# Altium schematic sheet 300_DC-DC.SchDoc: DC-DC Convertion stage
size A4; Date: XXXXXX; Author: Y.Gonzalez; Revision: R1V0; SheetNumber: 4; SheetTotal: 5
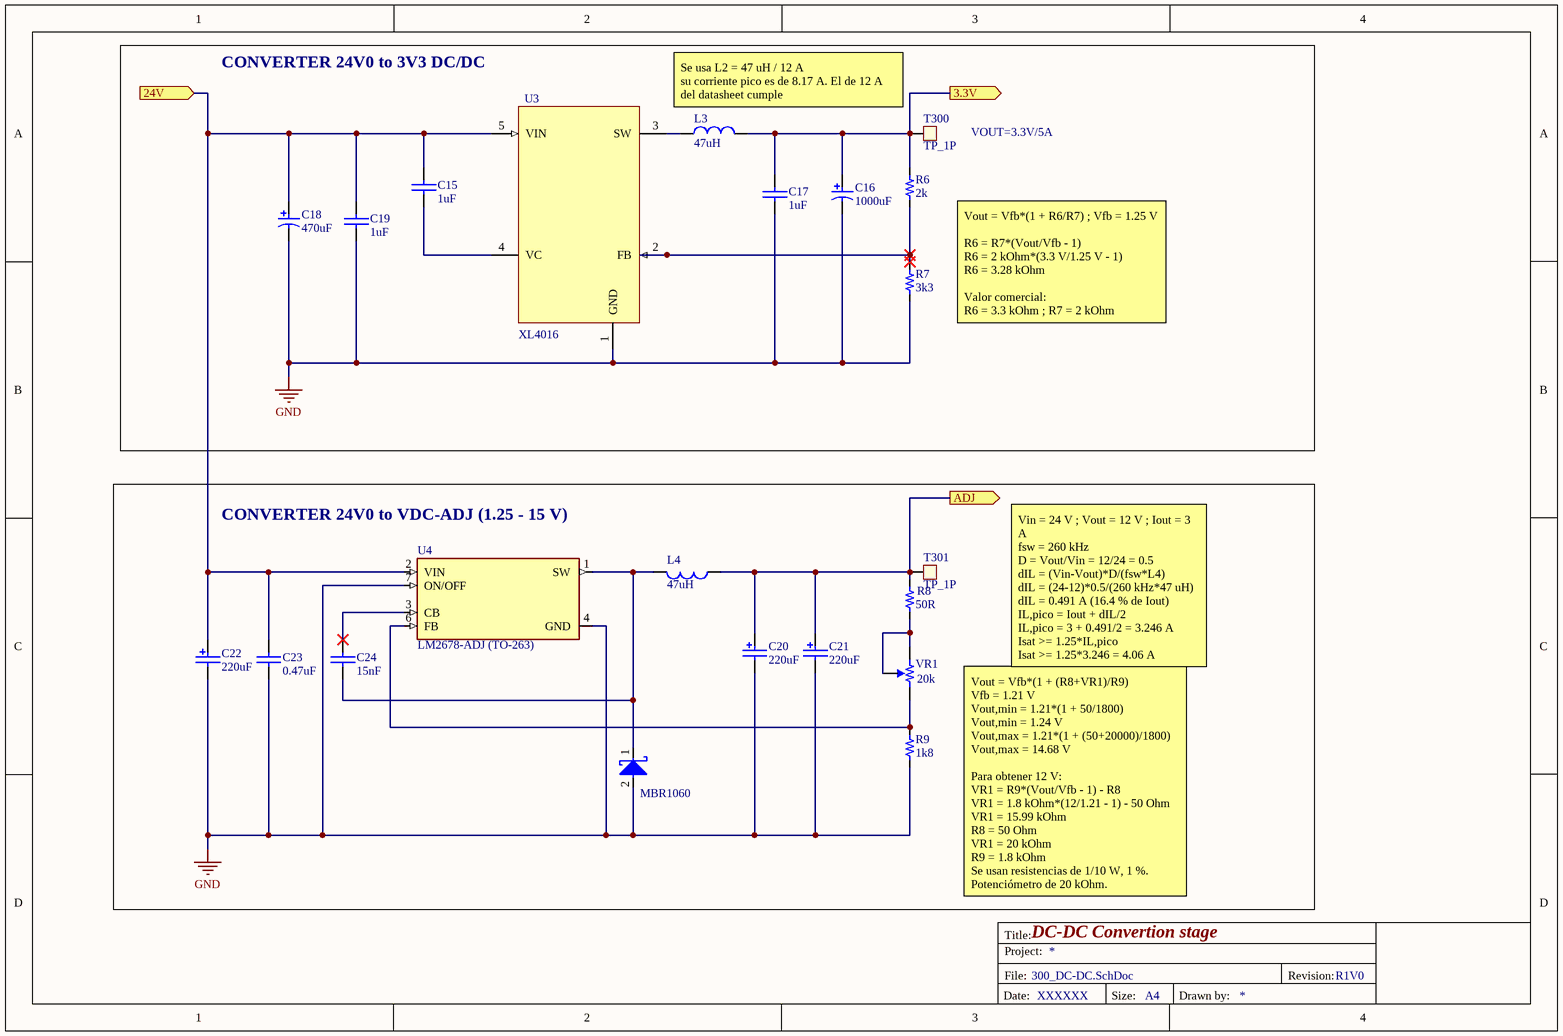
[diagram p0: 300_DC-DC.SchDoc]

## Parts
C15  value 1uF  [1206]  (hidden comment: 1uF 100V)
C16  value 1000uF  [RADIAL-CAN_LSx5mm_Diax10mm_Hx14mm]  (hidden comment: 1000uF 25V)
C17  value 1uF  [0805]  (hidden comment: 1uF 25V)
C18  value 470uF  [RADIAL-CAN-SMD_DIAX8MM_HX10MM]  (hidden comment: 470uF 10V)
C19  value 1uF  [1206]  (hidden comment: 1uF 100V)
C20  value 220uF  [RADIAL-CAN-SMD_Diax8mm_Hx10.2mm]  (hidden comment: 220uF 35V)
C21  value 220uF  [RADIAL-CAN-SMD_Diax8mm_Hx10.2mm]  (hidden comment: 220uF 35V)
C22  value 220uF  [RADIAL-CAN-SMD_Diax8mm_Hx10.2mm]  (hidden comment: 220uF 50V)
C23  value 0.47uF  [0603]  (hidden comment: 0.47uF_50v)
C24  value 15nF  [0603_1.4mm]  (hidden comment: 15nF 50V)
D2  MBR1060  [D_Schottky_60V_10A_TO]
L3  value 47uH  [L_47uH_12A]  (hidden comment: FIXED IND 47UH 12A 12.2 MOHM SMD)
L4  value 47uH  [L_47uH_12A]  (hidden comment: FIXED IND 47UH 12A 12.2 MOHM SMD)
R6  value 2k  [0201]  (hidden comment: 2k 1/20W)
R7  value 3k3  [0402]  (hidden comment: 3k3 1/16W)
R8  value 50R  [0603]  (hidden comment: 50R 1/18W)
R9  value 1k8  [0603]  (hidden comment: 1k8 1/10W)
T300  TP_1P  [TP_TH_30mil]  (no BOM)
T301  TP_1P  [TP_TH_30mil]  (no BOM)
U3  XL4016  [TO-263-5]
U4  LM2678-ADJ (TO-263)  [DCDC_ADJ_5A_TO263-7]
VR1  value 20k  [Pot_3x1_2.54mm_TH_TM]  (hidden comment: 20k 1/2W)

## Blocks framed on the sheet
CONVERTER 24V0 to 3V3 DC/DC: C15-C19 L3 R6 R7 T300 U3
CONVERTER 24V0 to VDC-ADJ (1.25 - 15 V): C20-C24 D2 L4 R8 R9 T301 U4 VR1

## Ports
3.3V (out), 24V (in), ADJ (out)

## Nets
GND: C16.2 C17.2 C18.2 C19.2 C20.2 C21.2 C22.2 C23.2 D2.2 R7.1 R9.1 U3.1(GND) U4.4(GND) U4.7(ON/OFF)
3.3V: C16.1 C17.1 L3.2 R6.2 T300.1 ; port 3.3V
24V: C15.1 C18.1 C19.1 C22.1 C23.1 U3.5(VIN) U4.2(VIN) ; port 24V
ADJ: C20.1 C21.1 L4.1 R8.2 T301.1 ; port ADJ
NetC15_2: C15.2 U3.4(VC)
NetC24_1: C24.1 U4.3(CB)
NetC24_2: C24.2 D2.1 L4.2 U4.1(SW)
NetL3_1: L3.1 U3.3(SW)
NetR6_1: R6.1 R7.2 U3.2(FB)
NetR8_1: R8.1 VR1.2 VR1.3
NetR9_2: R9.2 U4.6(FB) VR1.1

## Notes on the sheet
- Se usa L2 = 47 uH / 12 A
  su corriente pico es de 8.17 A. El de 12 A del datasheet cumple
- VOUT=3.3V/5A
- Vout = Vfb*(1 + R6/R7) ; Vfb = 1.25 V
  R6 = R7*(Vout/Vfb - 1)
  R6 = 2 kOhm*(3.3 V/1.25 V - 1)
  R6 = 3.28 kOhm
  Valor comercial:
  R6 = 3.3 kOhm ; R7 = 2 kOhm
  Vout = 1.25*(1 + 3.3k/2k)
  Vout = 3.31 V (0.38 %)
  Con tolerancia 1 %:
  Vout = 3.28 V a 3.34 V
  Se usan resistencias de 1/10 W, 1 %.
- Vin = 24 V ; Vout = 12 V ; Iout = 3 A
  fsw = 260 kHz
  D = Vout/Vin = 12/24 = 0.5
  dIL = (Vin-Vout)*D/(fsw*L4)
  dIL = (24-12)*0.5/(260 kHz*47 uH)
  dIL = 0.491 A (16.4 % de Iout)
  IL,pico = Iout + dIL/2
  IL,pico = 3 + 0.491/2 = 3.246 A
  Isat >= 1.25*IL,pico
  Isat >= 1.25*3.246 = 4.06 A
  Se usa L4 = 47 uH / 5 A
- Vout = Vfb*(1 + (R8+VR1)/R9)
  Vfb = 1.21 V
  Vout,min = 1.21*(1 + 50/1800)
  Vout,min = 1.24 V
  Vout,max = 1.21*(1 + (50+20000)/1800)
  Vout,max = 14.68 V
  Para obtener 12 V:
  VR1 = R9*(Vout/Vfb - 1) - R8
  VR1 = 1.8 kOhm*(12/1.21 - 1) - 50 Ohm
  VR1 = 15.99 kOhm
  R8 = 50 Ohm
  VR1 = 20 kOhm
  R9 = 1.8 kOhm
  Se usan resistencias de 1/10 W, 1 %.
  Potenciómetro de 20 kOhm.
- Title:
- Project:
- File:
- Revision:
- Date:
- Size:
- A4
- Drawn by:

## Library data of the parts
C15 C19 = Cap_1uF_1206_100V: CAP CER 1UF 100V X7R 1206; Manufacturer: Samsung Electro-Mechanics; Manufacturer Part Number: CL31B105KCHSNNE; Supplier 1: Digi-Key; Supplier Part Number 1: 1276-2747-1-ND; Last modified by: J.Jaramillo; Last modified date: 20240309; ComponentLink1Description: Digi-Key; ComponentLink1URL: https://www.digikey.com/en/products/detail/samsung-electro-mechanics/CL31B105KCHSNNE/3888405
C16 = Cap_1000uF_25V_ALU_THT: CAP 1000uf/25V,10*16,105℃ RADIAL; Manufacturer: SamXon; Manufacturer Part Number: KM 1000U/25V; Last modified by: J.Jaramillo; Last modified date: 20240309; Supplier 1: Poshton; Supplier Part Number 1: KM 1000U/25V
C17 = Cap_1uF_0805_25V: CAP CER 1UF 25V X7R 0805; Manufacturer: Yageo; Manufacturer Part Number: CC0805KKX7R8BB105; Supplier 1: Digi-Key; Supplier Part Number 1: 311-1456-1-ND; Last modified by: J.Jaramillo; Last modified date: 20240309; ComponentLink1Description: Digi-Key; ComponentLink1URL: https://www.digikey.com/product-detail/en/yageo/CC0805KKX7R8BB105/311-1456-1-ND/2833762
C18 = Cap_470uF_10V_ALU_SMD: 470uF 10V ±20% SMD,D8xL10mm Aluminum Electrolytic Capacitors; Manufacturer: Lelon; Manufacturer Part Number: VZH471M1ATT-0810L; Supplier 1: LCSC; Supplier Part Number 1: C723180; Last modified by: J.Jaramillo; Last modified date: 20240309; ComponentLink1Description: LCSC; ComponentLink1URL: https://lcsc.com/product-detail/Aluminum-Electrolytic-Capacitors-SMD_Lelon-VZH471M1ATT-0810L_C723180.html
C20 C21 = Cap_220uF_35V_ALU_SMD: CAP ALUM 220UF 20% 35V SMD; Manufacturer: Panasonic Electronic Components; Manufacturer Part Number: EEE-1VA221UP; Supplier 1: Digi-Key; Supplier Part Number 1: PCE3955CT-ND; Reel stock: N/A; Last modified by: J.Jaramillo; Last modified date: 20240309; ComponentLink1Description: Digi-Key; ComponentLink1URL: https://www.digikey.com/products/en?keywords=PCE3955CT-ND
C22 = Cap_220uF_50V_ALU_SMD: CAP ALUM 220UF 20% 50V SMD; Manufacturer: Panasonic; Manufacturer Part Number: EEE-FT1H221AP; Supplier 1: Mouser; Supplier Part Number 1: 667-EEE-FT1H221AP; Reel stock: N/A; Last modified by: J.Jaramillo; Last modified date: 20240309; ComponentLink1Description: Mouser; ComponentLink1URL: https://www.mouser.com/ProductDetail/Panasonic/EEE-FT1H221AP?qs=CMJjuEs1%252BuFFGBuxQbDfDA==
C23 = Cap_0.47uF_0603_50V: CAP CER 0.47UF 50V X5R 0603; Manufacturer: Taiyo Yuden; Manufacturer Part Number: UMK107ABJ474KA-T; Supplier 1: Digi-Key; Supplier Part Number 1: 587-3171-1-ND; Last modified by: J.Jaramillo; Last modified date: 20240309; ComponentLink1Description: Digi-Key; ComponentLink1URL: https://www.digikey.com/en/products/detail/taiyo-yuden/UMK107ABJ474KA-T/3194980?s=N4IgTCBcDaIKwA4DsBaAzARiRlOByAIgAQgC6AvkA
C24 = Cap_0.015uF_0603_50V: CAP CER 0.015UF 50V X7R 0603; Manufacturer: Samsung Electro-Mechanics; Manufacturer Part Number: CL10B153KB8NNNC; Supplier 1: Digi-Key; Supplier Part Number 1: 1276-1277-1-ND; Last modified by: J.Jaramillo; Last modified date: 20240309; ComponentLink1Description: Digi-Key; ComponentLink1URL: https://www.digikey.com/en/products/detail/samsung-electro-mechanics/CL10B153KB8NNNC/3886935?s=N4IgTCBcDaIMIBkCMAGAQkgrAZgNJoA4A5EuEAXQF8g
D2 = D_Schottky_60V_10A_TO: DIODE SCHOTTKY 60V TO-220AC-2; Manufacturer: SMC; Manufacturer Part Number 1: MBR1060; Supplier: LCSC; Supplier Part Number 1: C260256; Last modified date: 25102026; Last modified by: Y.Gonzalez; ComponentLink1Description: LCSC; ComponentLink1URL: https://www.lcsc.com/product-detail/C260256.html?s_z=n_q_x_MBR1060; ComponentLink2Description: Datasheet; ComponentLink2URL: https://www.lcsc.com/datasheet/C260256.pdf; Value: 60V
L3 L4 = L_47uH_12A: Manufacturer: Würth Elektronik; Manufacturer Part Number: 7443634700; Supplier 1: Digi-Key; Supplier Part Number 1: 732-2525-1-ND; Reel Stock: N/A; Last modified by: Y.Gonzalez; Last modified date: 23102026
R6 = Res_2k_0201_1/20W: RES SMD 2K OHM 1% 1/20W 0201; Manufacturer: Vishay Dale; Manufacturer Part Number: CRCW02012K00FNED; Supplier 1: Digi-Key; Supplier Part Number 1: 541-2.00KABCT-ND; Reel Stock: N/A; Last modified by: J.Jaramillo; Last modified date: 20240310; ComponentLink1Description: Digi-Key; ComponentLink1URL: https://www.digikey.com/en/products/detail/vishay-dale/CRCW02012K00FNED/1199840?s=N4IgTCBcDaIKwBYCMBaMA6ADJg0gQQCEBhAFRQDkAREAXQF8g
R7 = Res_3k3_0402_1/16W: RES SMD 3.3K OHM 5% 1/16W 0402; Manufacturer: Yageo; Manufacturer Part Number: RC0402JR-073K3L; Supplier 1: Digi-Key; Supplier Part Number 1: 311-3.3KJRCT-ND; Reel Stock: N/A; Last modified by: J.Jaramillo; Last modified date: 20240310; ComponentLink1Description: Digi-Key; ComponentLink1URL: https://www.digikey.com/product-detail/en/yageo/RC0402JR-073K3L/311-3-3KJRCT-ND/729403
R8 = Res_50R_0603_1/18W: RES SMD 50 OHM 0.1% 1/8W 0603; Manufacturer: Vishay Thin Film; Manufacturer Part Number: FC0603E50R0BST1; Supplier 1: Digi-Key; Supplier Part Number 1: FC0603-50BWCT-ND; Reel Stock: N/A; Last modified by: J.Jaramillo; Last modified date: 20240310; ComponentLink1Description: Digi-Key; ComponentLink1URL: https://www.digikey.com/product-detail/en/vishay-thin-film/FC0603E50R0BST1/FC0603-50BWTR-ND/1769755
R9 = Res_1k8_0603_1/10W: RES 1.8K OHM 1% 1/10W 0603; Manufacturer: Stackpole Electronics Inc; Manufacturer Part Number: RMCF0603FT1K80; Supplier 1: Digi-Key; Supplier Part Number 1: RMCF0603FT1K80CT-ND; Reel Stock: N/A; Last modified by: J.Jaramillo; Last modified date: 20240310; ComponentLink1Description: Digi-Key; ComponentLink1URL: https://www.digikey.com/product-detail/en/stackpole-electronics-inc/RMCF0603FT1K80/RMCF0603FT1K80CT-ND/1943005
T300 T301 = TP_TH_30mil: Test point 30mil hole size; Last modified by: J.Jaramillo; Last modified date: 20240310
U3 = DCDC_ADJ_12A_TO-220-5L: 180 KHz fixed frequency PWM buck (step-down) DC/DC converter, capable of driving a 12A load with high efficiency; Manufacturer: XLSEMI; Manufacturer Part Number: XL4016; Supplier 1: LCSC; Supplier Part Number 1: C55881; Reel Stock: N/A; Last modified by: Y.Gonzalez; Last modified date: 22102026; ComponentLink1Description: LCSC; ComponentLink1URL: https://www.lcsc.com/product-detail/C55881.html; ComponentLink2Description: Datasheet; ComponentLink2URL: https://www.snapeda.com/parts/XL4016/XLSEMI/datasheet/
U4 = DCDC_ADJ_5A_TO263-7: IC REG BUCK ADJ 5A TO220-7; Manufacturer: Texas Instruments; Manufacturer Part Number: 296-43516-5-ND; Supplier 1: Digi-Key; Supplier Part Number 1: LM2678T-ADJ; Reel Stock: N/A; Last modified by: Y.Gonzalez; Last modified date: 23102026; ComponentLink1Description: DigiKey; ComponentLink1URL: https://www.digikey.com/es/products/detail/texas-instruments/LM2678T-ADJ/3695077; ComponentLink2Description: datasheet; ComponentLink2URL: https://www.ti.com/lit/ds/symlink/lm2678.pdf?HQS=dis-dk-null-digikeymode-dsf-pf-null-wwe&ts=1792805774583
VR1 = Pot_20k_1/2W_TH_TM: TRIMMER 20K OHM 0.5W PC PIN TOP; Manufacturer: Bourns Inc.; Manufacturer Part Number: 3296W-1-203LF; Reel Stock: N/A; Last modified by: J.Jaramillo; Last modified date: 20240310; Supplier 1: Digi-Key; Supplier Part Number 1: 3296W-203LF-ND